# Altium schematic sheet 51_INPUT_PROTECTION.SchDoc
size A4; SheetNumber: 11; SheetTotal: 16
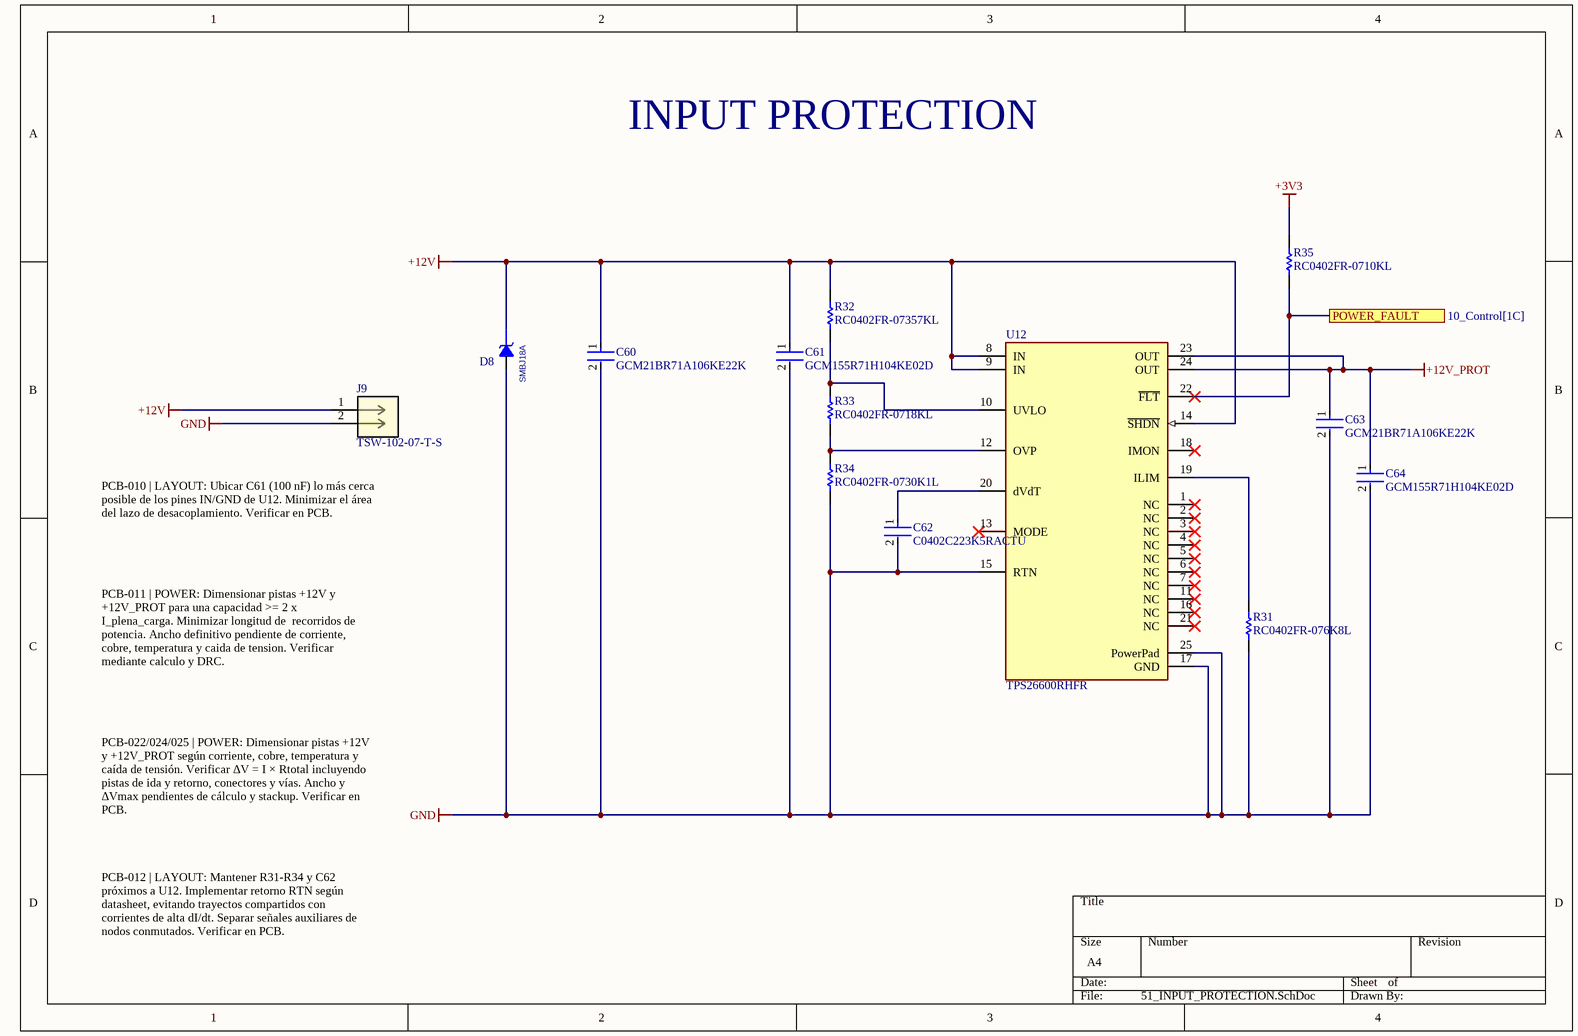
[diagram p0: 51_INPUT_PROTECTION.SchDoc]

## Parts
C60  GCM21BR71A106KE22K  [FP-GCM21B-0_15-MFG]
C61  GCM155R71H104KE02D  [FP-GCM155-0_05-IPC_A]
C62  C0402C223K5RACTU  [FP-C0402-BB-MFG]
C63  GCM21BR71A106KE22K  [FP-GCM21B-0_15-MFG]
C64  GCM155R71H104KE02D  [FP-GCM155-0_05-IPC_A]
D8  SMBJ18A  [ST_SMB]
J9  TSW-102-07-T-S  [CON2_1X2_TU_TSW]
R31  RC0402FR-076K8L  [RESC1005X40X25ML05T10]
R32  RC0402FR-07357KL  [RESC1005X40X25LL05T10]
R33  RC0402FR-0718KL  [RESC1005X40X25LL05T10]
R34  RC0402FR-0730K1L  [RESC1005X40X25NL05T10]
R35  RC0402FR-0710KL  [RESC1005X40X25LL05T10]
U12  TPS26600RHFR  [FP-RHF0024A-IPC_A]

## Ports
POWER_FAULT (see 10_Control[1C])

## Nets
+3V3: R35.2
+12V: C60.1 C61.1 D8.1(K) J9.1 R32.2 U12.8(IN) U12.9(IN) U12.14(~{SHDN})
+12V_PROT: C63.1 C64.1 U12.23(OUT) U12.24(OUT)
GND: C60.2 C61.2 C62.2 C63.2 C64.2 D8.2(A) J9.2 R31.1 R34.1 U12.15(RTN) U12.17(GND) U12.25(PowerPad)
POWER_FAULT: R35.1 U12.22(~{FLT}) ; port POWER_FAULT
NetC62_1: C62.1 U12.20(dVdT)
NetR31_2: R31.2 U12.19(ILIM)
NetR32_1: R32.1 R33.2 U12.10(UVLO)
NetR33_1: R33.1 R34.2 U12.12(OVP)

Not connected (* = marked no-connect by the designer): U12 1(NC)* 2(NC)* 3(NC)* 4(NC)* 5(NC)* 6(NC)* 7(NC)* 11(NC)* 13(MODE)* 16(NC)* 18(IMON)* 21(NC)*

## Notes on the sheet
- INPUT PROTECTION
- PCB-010 | LAYOUT: Ubicar C61 (100 nF) lo más cerca posible de los pines IN/GND de U12. Minimizar el área del lazo de desacoplamiento. Verificar en PCB.
- PCB-011 | POWER: Dimensionar pistas +12V y +12V_PROT para una capacidad >= 2 x I_plena_carga. Minimizar longitud de  recorridos de potencia. Ancho definitivo pendiente de corriente, cobre, temperatura y caida de tension. Verificar mediante calculo y DRC.
- PCB-022/024/025 | POWER: Dimensionar pistas +12V y +12V_PROT según corriente, cobre, temperatura y caída de tensión. Verificar ΔV = I × Rtotal incluyendo pistas de ida y retorno, conectores y vías. Ancho y ΔVmax pendientes de cálculo y stackup. Verificar en PCB.
- PCB-012 | LAYOUT: Mantener R31-R34 y C62 próximos a U12. Implementar retorno RTN según datasheet, evitando trayectos compartidos con corrientes de alta dI/dt. Separar señales auxiliares de nodos conmutados. Verificar en PCB.

## Library data of the parts
C60 C63 = CMP-06035-062139-1: Ceramic Capacitor for Automotive 10uF ±10% 10VDC X7R 0805 Embossed T/R; Voltage Rating: 10V; Mount: Surface Mount; Max Operating Temperature: 125°C; Tolerance: 10%; Voltage Rating (DC): 10V; Dielectric: X7R; RoHS Compliant: Yes; Package Quantity: 10000; Min Operating Temperature: -55°C; Case/Package: 0805; Case Code (Imperial): 0805; Thickness: 0.055inch; Weight: 0.000335oz; Length: 0.079inch; Ratings: AEC-Q200; Case Code (Metric): 2012; Termination: SMD/SMT; Width: 1.25mm; Height: 1.25mm; Packaging: Tape and Reel; Capacitance: 10uF
C61 C64 = CMP-2000-07456-3: Ceramic Capacitor for Automotive 100nF ±10% 50VDC X7R 0402 Paper T/R; Voltage Rating (DC): 50V; Capacitance: 100nF; Package Quantity: 10000; Tolerance: 10%; Height: 0.5mm; Mount: Surface Mount; Voltage Rating: 50V; Weight: 0.000212oz; Thickness: 0.022inch; Case Code (Imperial): 0402; Length: 0.039inch; Packaging: Tape and Reel; Case Code (Metric): 1005; Min Operating Temperature: -55°C; Termination: SMD/SMT; REACH SVHC: No SVHC; Max Operating Temperature: 125°C; Lead Free: Lead Free; Dielectric: X7R; Ratings: AEC-Q200; Width: 0.5mm; Case/Package: 0402
C62 = CMP-2008-03151-2: CAP CER 0.022UF 50V 10% X7R 0402; Manufacturer: Kemet; Tolerance: 0.1; Temperature Coefficient: 15%; Capacitance: 22,000 pF; Material: Ceramic; Value: 22,000 pF; Lead Free: Yes; ComponentLink2URL: https://content.kemet.com/datasheets/KEM_C1002_X7R_SMD.pdf; Category: Cap; Digikey Description: CAP CER 0.022UF 50V 10% X7R 0402; Manufacturer Part Number: C0402C223K5RACTU; Mouser Description: 0402 C 22nF Ceramic Multilayer Capacitor, 50 V, +125degC, X7R Dielectric, +/-10%; Temperature: -55°C to +125°C; Temperature Range High: +125°C; Device Class L3: Ceramic Capacitors; Device Class L1: Passive Components; Height: 0.55mm; Package: C0402-BB; Octopart: https://octopart.com/c0402c223k5ractu-kemet-99241; Temperature Range Low: -55°C; Voltage Rating: 50 V; Ipc Land Pattern Name: CAPC10050X50; ComponentLink2Description: Datasheet; Automotive: No; Temperature Characteristic: X7R; RoHS: TRUE; Device Class L2: Capacitors
J9 = TSW-102-07-T-S: Description; Manufacturer_Name: Samtec Inc; Copyright: Copyright (C) 2025 Ultra Librarian. All rights reserved.; Manufacturer_Part_Number: TSW-102-07-T-S; RefDes: RefDes; Type: Type
R31 = CMP-2002-07004-1: Manufacturer: Yageo / Phycomp; Part Number: RC0402FR-076K8L
R32 = CMP-2002-07627-1: Manufacturer: Yageo / Phycomp; Part Number: RC0402FR-07357KL
R33 = CMP-1011-00650-2: Manufacturer: Yageo / Phycomp; Part Number: RC0402FR-0718KL
R34 = CMP-2002-07600-1: Manufacturer: Yageo / Phycomp; Part Number: RC0402FR-0730K1L
R35 = CMP-2002-07353-1: Manufacturer: Yageo / Phycomp; Part Number: RC0402FR-0710KL
U12 = CMP-04913-000047-1: IC PWR MGMT EFUSE 60V 24VQFN; Number of Channels: 1; Accuracy: 5%; Output Current: 2.35A; Min Operating Temperature: -40°C; RoHS Compliant: Yes; Case/Package: VQFN; Max Operating Temperature: 125°C; Mount: Surface Mount; Packaging: Cut Tape